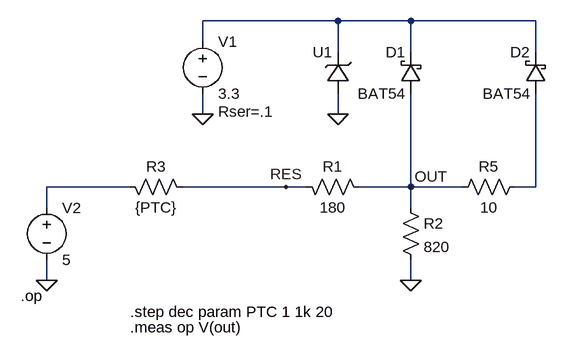
[diagram p0: schematic PTCIN.asc]
PTCIN.asc, the LTspice schematic file:
Version 4
SHEET 1 880 680
WIRE 256 112 48 112
WIRE 368 112 256 112
WIRE 560 112 368 112
WIRE 48 144 48 112
WIRE 256 160 256 112
WIRE 368 160 368 112
WIRE 560 160 560 112
WIRE 48 256 48 224
WIRE 256 256 256 224
WIRE -64 368 -192 368
WIRE 176 368 16 368
WIRE 208 368 176 368
WIRE 368 368 368 224
WIRE 368 368 288 368
WIRE 448 368 368 368
WIRE 560 368 560 224
WIRE 560 368 528 368
WIRE -192 400 -192 368
WIRE 368 400 368 368
WIRE -192 512 -192 480
WIRE 368 512 368 480
FLAG 48 256 0
FLAG 256 256 0
FLAG -192 512 0
FLAG 368 512 0
FLAG 368 368 OUT
FLAG 176 368 RES
SYMBOL voltage 48 128 R0
WINDOW 123 0 0 Left 0
WINDOW 39 24 124 Left 2
SYMATTR InstName V1
SYMATTR Value 3.3
SYMATTR SpiceLine Rser=.1
SYMBOL schottky 384 224 R180
WINDOW 0 24 64 Left 2
WINDOW 3 24 0 Left 2
SYMATTR InstName D1
SYMATTR Value BAT54
SYMATTR Description Diode
SYMATTR Type diode
SYMBOL voltage -192 384 R0
WINDOW 123 0 0 Left 0
WINDOW 39 0 0 Left 0
SYMATTR InstName V2
SYMATTR Value 5
SYMBOL res 192 352 M90
WINDOW 0 0 56 VBottom 2
WINDOW 3 32 56 VTop 2
SYMATTR InstName R1
SYMATTR Value 180
SYMBOL res 352 384 R0
SYMATTR InstName R2
SYMATTR Value 820
SYMBOL BZT52C3V6 272 224 R180
WINDOW 0 24 64 Left 2
WINDOW 3 24 0 Invisible 2
SYMATTR InstName U1
SYMATTR Value ""
SYMBOL res -80 352 M90
WINDOW 0 0 56 VBottom 2
WINDOW 3 32 56 VTop 2
SYMATTR InstName R3
SYMATTR Value {PTC}
SYMBOL res 544 352 R90
WINDOW 0 0 56 VBottom 2
WINDOW 3 32 56 VTop 2
SYMATTR InstName R5
SYMATTR Value 10
SYMBOL schottky 576 224 R180
WINDOW 0 24 64 Left 2
WINDOW 3 24 0 Left 2
SYMATTR InstName D2
SYMATTR Value BAT54
SYMATTR Description Diode
SYMATTR Type diode
TEXT -232 536 Left 2 !.op
TEXT -64 560 Left 2 !.step dec param PTC 1 1k 20
TEXT -64 584 Left 2 !.meas op V(out)

The netlist it stands for:
* PTCIN.asc
V1 N001 0 3.3 Rser=.1
D1 OUT N001 BAT54
V2 N002 0 5
R1 RES OUT 180
R2 OUT 0 820
XU1 0 N001 BZT52C3V6  ; pins + -
R3 N002 RES {PTC}
R5 N003 OUT 10
D2 N003 N001 BAT54
.model D D
.lib standard.dio
.op
.step dec param PTC 1 1k 20
.meas op V(out)
.lib BZT52C3V6.lib
.backanno
.end